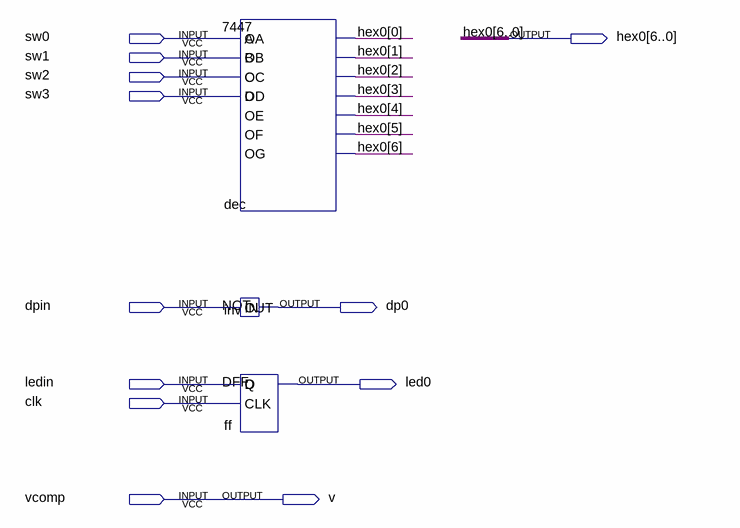
[diagram p0: schematic sheet]
// Quartus schematic de0test.bdf as structural Verilog: 3 symbols, 12 pins
module de0test (
  input  sw0,
  input  sw1,
  input  sw2,
  input  sw3,
  input  dpin,
  input  ledin,
  input  clk,
  input  vcomp,
  output [6:0] hex0,
  output dp0,
  output led0,
  output v
);

  \7447  dec (
    .A(sw0), .B(sw1), .C(sw2), .D(sw3), .OA(hex0[0]), .OB(hex0[1]), .OC(hex0[2]), .OD(hex0[3]), .OE(hex0[4]),
    .OF(hex0[5]), .OG(hex0[6]));
  not inv (dp0, dpin);
  DFF ff (.D(ledin), .CLK(clk), .Q(led0));

  assign v = vcomp;
endmodule
